# Altium project ADC_System_PCB.PrjPcb (part 2 of 3)

## Sheet double_preamp.SchDoc: 2-Channel programmable gain amplifier
size A4; DocumentNumber: ADC-SCH-07; SheetNumber: 7; SheetTotal: 20
Used 2 times, as channels U_analog_assembly/U_signal_processing_assembly/U_double_preamp, U_analog_assembly/U_signal_processing_assembly/U_double_preamp. Parts and nets are listed once, with the designators drawn on the sheet.
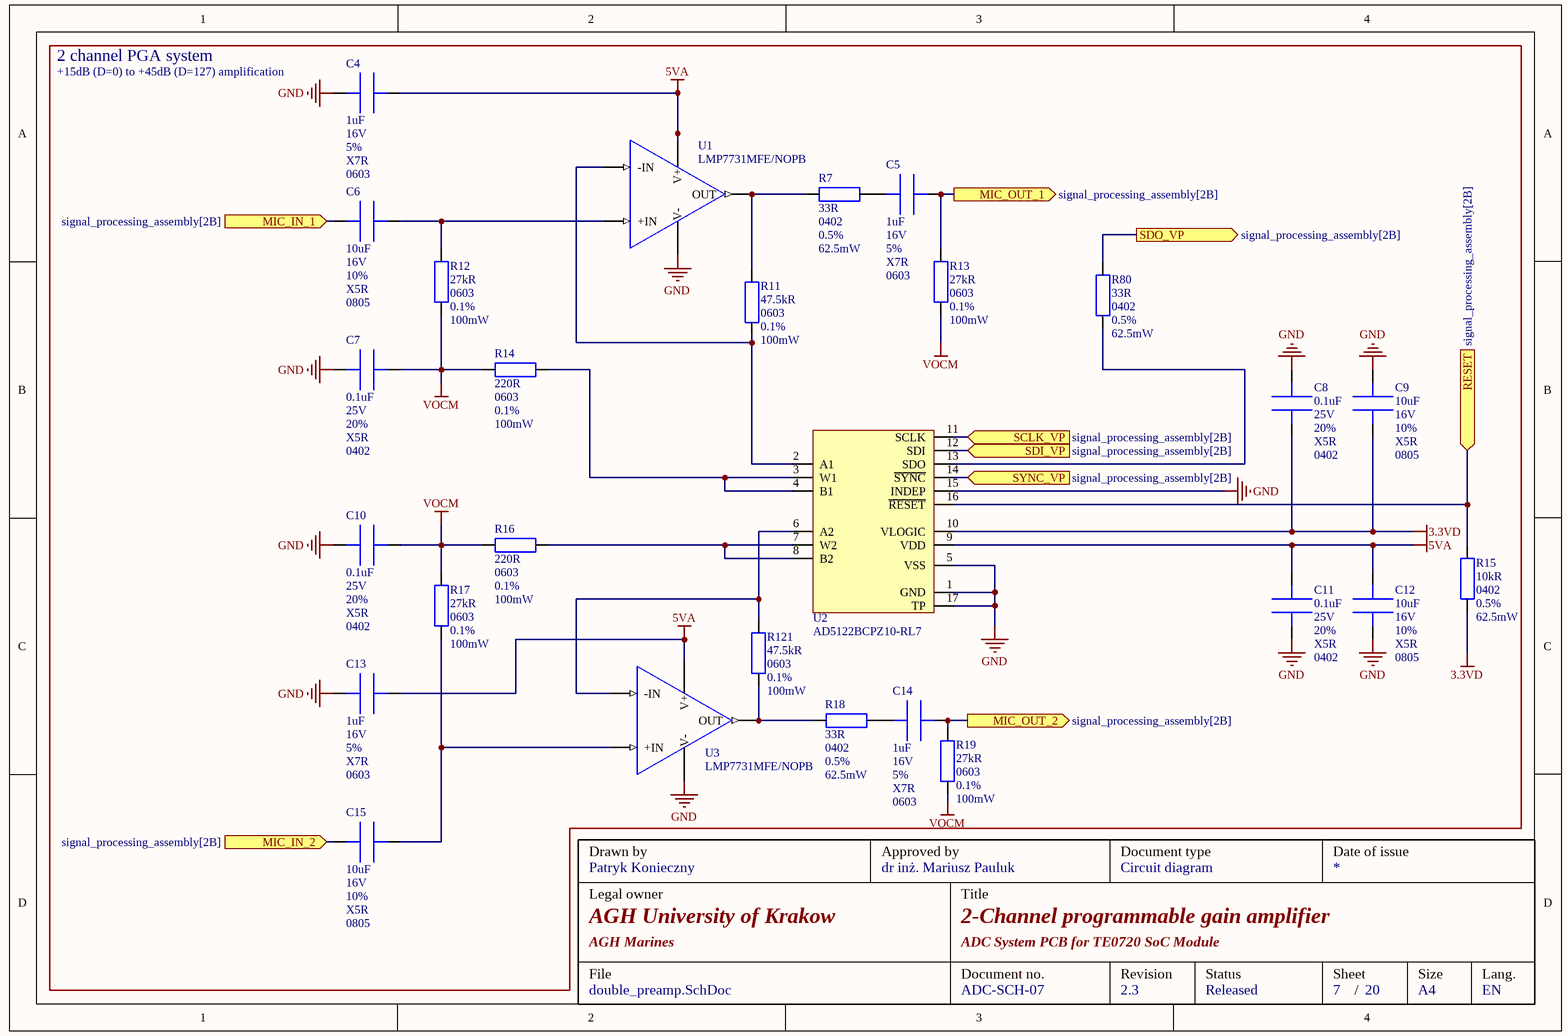
[diagram p10: double_preamp.SchDoc]

### Parts
C4  value 1uF  Voltage: 16V  Tolerance: 5%  Dielectric: X7R  Package: 0603  [CAPC_0603]  (hidden comment: CC0603JRX7R7BB105)
C5  value 1uF  Voltage: 16V  Tolerance: 5%  Dielectric: X7R  Package: 0603  [CAPC_0603]  (hidden comment: CC0603JRX7R7BB105)
C6  value 10uF  Voltage: 16V  Tolerance: 10%  Dielectric: X5R  Package: 0805  [CAPC_0805]  (hidden comment: EMK212BJ106KG-T)
C7  value 0.1uF  Voltage: 25V  Tolerance: 20%  Dielectric: X5R  Package: 0402  [CAPC_0402]  (hidden comment: MSAST105SB5104MFNA01)
C8  value 0.1uF  Voltage: 25V  Tolerance: 20%  Dielectric: X5R  Package: 0402  [CAPC_0402]  (hidden comment: MSAST105SB5104MFNA01)
C9  value 10uF  Voltage: 16V  Tolerance: 10%  Dielectric: X5R  Package: 0805  [CAPC_0805]  (hidden comment: EMK212BJ106KG-T)
C10  value 0.1uF  Voltage: 25V  Tolerance: 20%  Dielectric: X5R  Package: 0402  [CAPC_0402]  (hidden comment: MSAST105SB5104MFNA01)
C11  value 0.1uF  Voltage: 25V  Tolerance: 20%  Dielectric: X5R  Package: 0402  [CAPC_0402]  (hidden comment: MSAST105SB5104MFNA01)
C12  value 10uF  Voltage: 16V  Tolerance: 10%  Dielectric: X5R  Package: 0805  [CAPC_0805]  (hidden comment: EMK212BJ106KG-T)
C13  value 1uF  Voltage: 16V  Tolerance: 5%  Dielectric: X7R  Package: 0603  [CAPC_0603]  (hidden comment: CC0603JRX7R7BB105)
C14  value 1uF  Voltage: 16V  Tolerance: 5%  Dielectric: X7R  Package: 0603  [CAPC_0603]  (hidden comment: CC0603JRX7R7BB105)
C15  value 10uF  Voltage: 16V  Tolerance: 10%  Dielectric: X5R  Package: 0805  [CAPC_0805]  (hidden comment: EMK212BJ106KG-T)
R7  value 33R  Package: 0402  Tolerance: 0.5%  Power: 62.5mW  [RESC_0402]  (hidden comment: RG1005R-330-D-T10)
R11  value 47.5kR  Package: 0603  Tolerance: 0.1%  Power: 100mW  [RESC_0603]  (hidden comment: ERA-3AEB4752V)
R12  value 27kR  Package: 0603  Tolerance: 0.1%  Power: 100mW  [RESC_0603]  (hidden comment: ERA-3AEB273V)
R13  value 27kR  Package: 0603  Tolerance: 0.1%  Power: 100mW  [RESC_0603]  (hidden comment: ERA-3AEB273V)
R14  value 220R  Package: 0603  Tolerance: 0.1%  Power: 100mW  [RESC_0603]  (hidden comment: RT0603BRE07220RL)
R15  value 10kR  Package: 0402  Tolerance: 0.5%  Power: 62.5mW  [RESC_0402]  (hidden comment: AC0402DR-0710KL)
R16  value 220R  Package: 0603  Tolerance: 0.1%  Power: 100mW  [RESC_0603]  (hidden comment: RT0603BRE07220RL)
R17  value 27kR  Package: 0603  Tolerance: 0.1%  Power: 100mW  [RESC_0603]  (hidden comment: ERA-3AEB273V)
R18  value 33R  Package: 0402  Tolerance: 0.5%  Power: 62.5mW  [RESC_0402]  (hidden comment: RG1005R-330-D-T10)
R19  value 27kR  Package: 0603  Tolerance: 0.1%  Power: 100mW  [RESC_0603]  (hidden comment: ERA-3AEB273V)
R80  value 33R  Package: 0402  Tolerance: 0.5%  Power: 62.5mW  [RESC_0402]  (hidden comment: RG1005R-330-D-T10)
R121  value 47.5kR  Package: 0603  Tolerance: 0.1%  Power: 100mW  [RESC_0603]  (hidden comment: ERA-3AEB4752V)
U1  LMP7731MFE/NOPB  [IC_SOT-23-5]
U2  AD5122BCPZ10-RL7  [IC_LFCSP-16]
U3  LMP7731MFE/NOPB  [IC_SOT-23-5]

### Ports
MIC_IN_1 (in, see signal_processing_assembly[2B]), MIC_IN_2 (in, see signal_processing_assembly[2B]), MIC_OUT_1 (out, see signal_processing_assembly[2B]), MIC_OUT_2 (out, see signal_processing_assembly[2B]), RESET (in, see signal_processing_assembly[2B]), SCLK_VP (in, see signal_processing_assembly[2B]), SDI_VP (in, see signal_processing_assembly[2B]), SDO_VP (out, see signal_processing_assembly[2B]), SYNC_VP (in, see signal_processing_assembly[2B])

### Nets
3.3VD: C8.2 C9.2 R15.2 U2.10(VLOGIC)
5VA: C4.1 C11.1 C12.1 C13.1 U1.5(V+) U2.9(VDD) U3.5(V+)
GND: C4.2 C7.2 C8.1 C9.1 C10.2 C11.2 C12.2 C13.2 U1.2(V-) U2.1(GND) U2.5(VSS) U2.15(INDEP) U2.17(TP) U3.2(V-)
VOCM: C7.1 C10.1 R12.2 R13.2 R14.2 R16.2 R17.1 R19.2
MIC_IN_1: C6.2 ; port MIC_IN_1
MIC_IN_2: C15.2 ; port MIC_IN_2
MIC_OUT_1: C5.1 R13.1 ; port MIC_OUT_1
MIC_OUT_2: C14.1 R19.1 ; port MIC_OUT_2
RESET: R15.1 U2.16(~{RESET}) ; port RESET
SCLK_VP: U2.11(SCLK) ; port SCLK_VP
SDI_VP: U2.12(SDI) ; port SDI_VP
SDO_VP: R80.1 ; port SDO_VP
SYNC_VP: U2.14(~{SYNC}) ; port SYNC_VP
NetC5_2: C5.2 R7.1
NetC6_1: C6.1 R12.1 U1.3(+IN)
NetC14_2: C14.2 R18.1
NetC15_1: C15.1 R17.2 U3.3(+IN)
NetR7_2: R7.2 R11.1 U1.1(OUT)
NetR11_2: R11.2 U1.4(-IN) U2.2(A1)
NetR14_1: R14.1 U2.3(W1) U2.4(B1)
NetR16_1: R16.1 U2.7(W2) U2.8(B2)
NetR18_2: R18.2 R121.2 U3.1(OUT)
NetR80_2: R80.2 U2.13(SDO)
NetR121_1: R121.1 U2.6(A2) U3.4(-IN)

### Channels
U_analog_assembly/U_signal_processing_assembly/U_double_preamp: designators end in _U_double_preamp2; ports MIC_IN_1=NetC6_U_double_preamp2_2 MIC_IN_2=NetC15_U_double_preamp2_2 MIC_OUT_1=NetC5_U_double_preamp2_1 MIC_OUT_2=NetC14_U_double_preamp2_1 RESET=NetJM1_47 SCLK_VP=SCLK_VP SDI_VP=NetR80_U_double_preamp1_1 SDO_VP=SDI_VP SYNC_VP=SYNC_VP
U_analog_assembly/U_signal_processing_assembly/U_double_preamp: designators end in _U_double_preamp1; ports MIC_IN_1=NetC6_U_double_preamp1_2 MIC_IN_2=NetC15_U_double_preamp1_2 MIC_OUT_1=NetC5_U_double_preamp1_1 MIC_OUT_2=NetC14_U_double_preamp1_1 RESET=NetJM1_45 SCLK_VP=SCLK_VP SDI_VP=SDO_VP SDO_VP=NetR80_U_double_preamp1_1 SYNC_VP=SYNC_VP

### Notes on the sheet
- 2 channel PGA system
- (near C4) +15dB (D=0) to +45dB (D=127) amplification
- Drawn by
- Approved by
- Document type
- Date of issue
- Legal owner
- Title
- Circuit diagram
- File
- AGH Marines
- Document no.
- Revision
- Status
- Sheet
- Size
- Lang.
- /
- A4
- EN

### Library data of the parts
C4 C5 C13 C14 = CC0603JRX7R7BB105: as C1 on sheet MIC_connection; Supplier 1: Mouser; Supplier Part Number 1: 603-CC0603JRX77BB105
C6 C9 C12 C15 = EMK212BJ106KG-T: Multilayer Ceramic Capacitors MLCC - SMD/SMT 16V 10uF X5R 0805 10 %; Manufacturer: TAIYO YUDEN; Supplier 1: Mouser; Supplier Part Number 1: 963-EMK212BJ106KG-T
C7 C8 C10 C11 = MSAST105SB5104MFNA01: as C61 on sheet JTAG; Supplier 1: Mouser; Supplier Part Number 1: 963-MSAST105SB5104MF
R7 R18 R80 = RG1005R-330-D-T10: as R110 on sheet JTAG; Supplier 1: Mouser; Supplier Part Number 1: 754-RG1005R-330DT10
R11 R121 = ERA-3AEB4752V: Thin Film Resistors 0603 47.5Kohm 0.1% 25ppm; Manufacturer: Panasonic; Supplier 1: Mouser; Supplier Part Number 1: 667-ERA-3AEB4752V
R12 R13 R17 R19 = ERA-3AEB273V: Thin Film Resistors 0603 1/10W 27Kohms; Manufacturer: Panasonic; Supplier 1: Mouser; Supplier Part Number 1: 667-ERA-3AEB273V
R14 R16 = RT0603BRE07220RL: Thin Film Resistors; Manufacturer: YAGEO; Supplier 1: Mouser; Supplier Part Number 1: 603-RT0603BRE07220RL
R15 = AC0402DR-0710KL: as R96 on sheet power_management; Supplier 1: Mouser; Supplier Part Number 1: 603-AC0402DR-0710KL
U1 U3 = LMP7731MFE/NOPB: Precision Amplifiers Single 2.9 nV/sqrt(H z) Low Noise Precis A 926-LMP7731MF/NOPB; Manufacturer: Texas Instruments; Package: SOT-23-5; Supplier 1: Mouser; Supplier Part Number 1: 926-LMP7731MFE/NOPB
U2 = AD5122BCPZ10-RL7: Digital Potentiometer ICs 128tap, Dual DigiPOT, NVM, SPI; Manufacturer: Analog Devices; Package: LFCSP-16; Supplier 1: Mouser; Supplier Part Number 1: 584-AD5122BCPZ10-R7

## Sheet double_single_to_diff_conv.SchDoc: Single ended to differential analog signal conversion
size A4; DocumentNumber: ADC-SCH-08; SheetNumber: 8; SheetTotal: 20
Used 2 times, as channels U_analog_assembly/U_signal_processing_assembly/U_double_single_to_diff_conv, U_analog_assembly/U_signal_processing_assembly/U_double_single_to_diff_conv. Parts and nets are listed once, with the designators drawn on the sheet.
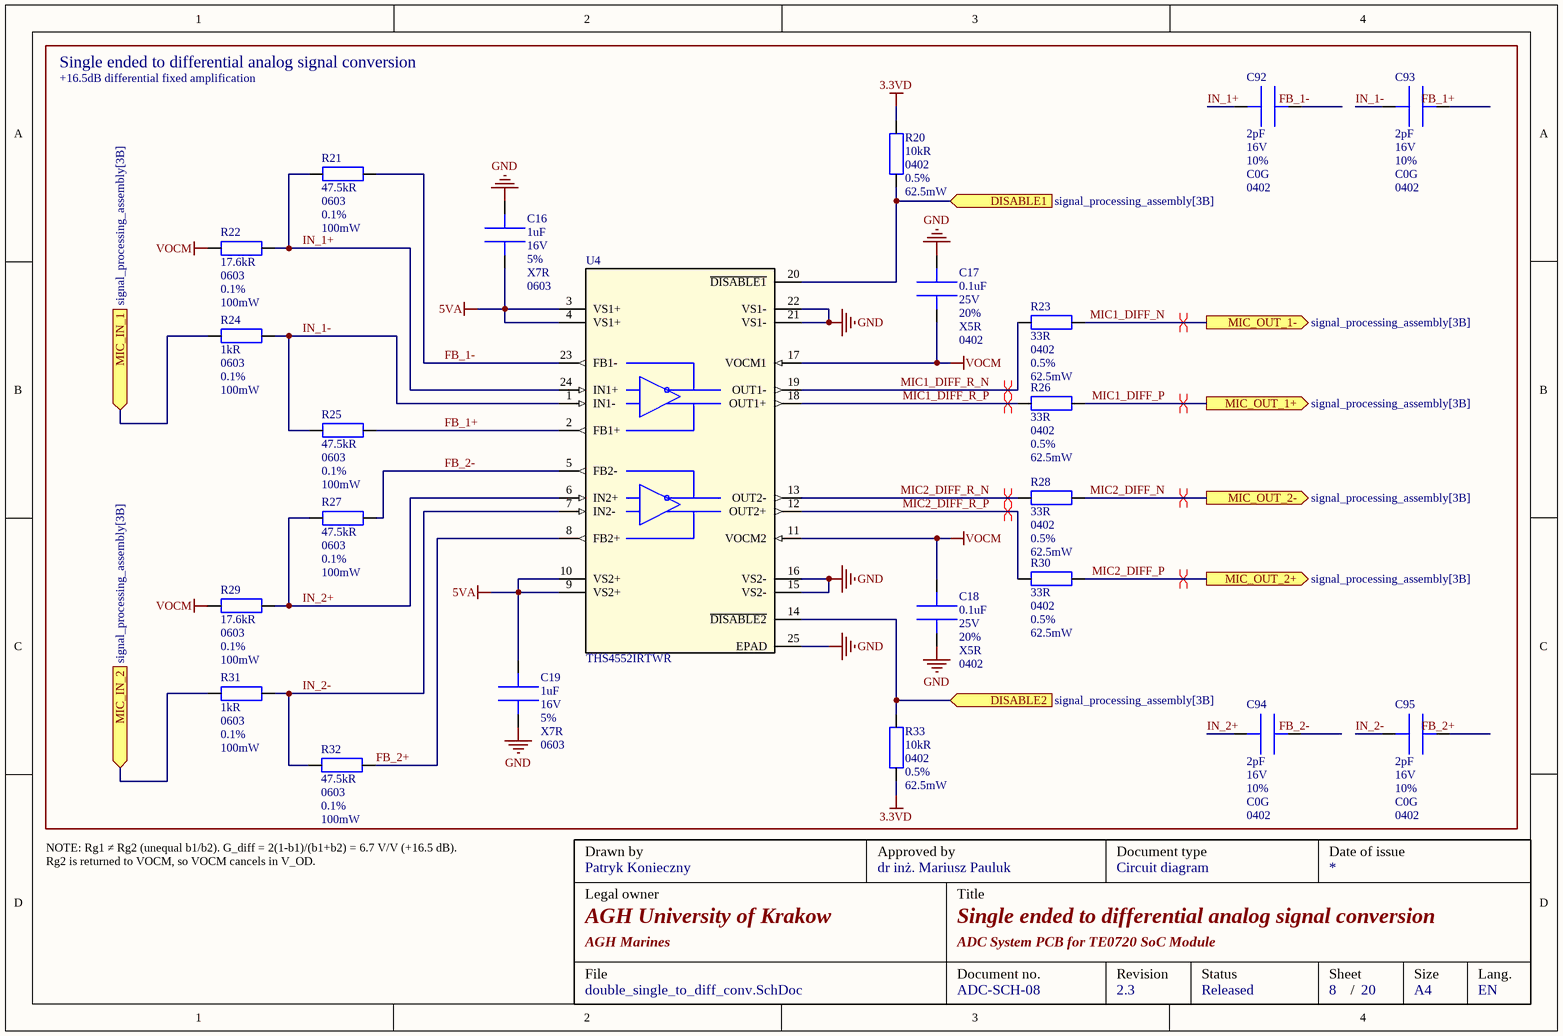
[diagram p11: double_single_to_diff_conv.SchDoc]

### Parts
C16  value 1uF  Voltage: 16V  Tolerance: 5%  Dielectric: X7R  Package: 0603  [CAPC_0603]  (hidden comment: CC0603JRX7R7BB105)
C17  value 0.1uF  Voltage: 25V  Tolerance: 20%  Dielectric: X5R  Package: 0402  [CAPC_0402]  (hidden comment: MSAST105SB5104MFNA01)
C18  value 0.1uF  Voltage: 25V  Tolerance: 20%  Dielectric: X5R  Package: 0402  [CAPC_0402]  (hidden comment: MSAST105SB5104MFNA01)
C19  value 1uF  Voltage: 16V  Tolerance: 5%  Dielectric: X7R  Package: 0603  [CAPC_0603]  (hidden comment: CC0603JRX7R7BB105)
C92  value 2pF  Voltage: 16V  Tolerance: 10%  Dielectric: C0G  Package: 0402  [CAPC_0402]  (hidden comment: GJM1555C1H2R0CB01J)
C93  value 2pF  Voltage: 16V  Tolerance: 10%  Dielectric: C0G  Package: 0402  [CAPC_0402]  (hidden comment: GJM1555C1H2R0CB01J)
C94  value 2pF  Voltage: 16V  Tolerance: 10%  Dielectric: C0G  Package: 0402  [CAPC_0402]  (hidden comment: GJM1555C1H2R0CB01J)
C95  value 2pF  Voltage: 16V  Tolerance: 10%  Dielectric: C0G  Package: 0402  [CAPC_0402]  (hidden comment: GJM1555C1H2R0CB01J)
R20  value 10kR  Package: 0402  Tolerance: 0.5%  Power: 62.5mW  [RESC_0402]  (hidden comment: AC0402DR-0710KL)
R21  value 47.5kR  Package: 0603  Tolerance: 0.1%  Power: 100mW  [RESC_0603]  (hidden comment: ERA-3AEB4752V)
R22  value 17.6kR  Package: 0603  Tolerance: 0.1%  Power: 100mW  [RESC_0603]  (hidden comment: TNPW060317K6BEEA)
R23  value 33R  Package: 0402  Tolerance: 0.5%  Power: 62.5mW  [RESC_0402]  (hidden comment: RG1005R-330-D-T10)
R24  value 1kR  Package: 0603  Tolerance: 0.1%  Power: 100mW  [RESC_0603]  (hidden comment: RP0603BRD071KL)
R25  value 47.5kR  Package: 0603  Tolerance: 0.1%  Power: 100mW  [RESC_0603]  (hidden comment: ERA-3AEB4752V)
R26  value 33R  Package: 0402  Tolerance: 0.5%  Power: 62.5mW  [RESC_0402]  (hidden comment: RG1005R-330-D-T10)
R27  value 47.5kR  Package: 0603  Tolerance: 0.1%  Power: 100mW  [RESC_0603]  (hidden comment: ERA-3AEB4752V)
R28  value 33R  Package: 0402  Tolerance: 0.5%  Power: 62.5mW  [RESC_0402]  (hidden comment: RG1005R-330-D-T10)
R29  value 17.6kR  Package: 0603  Tolerance: 0.1%  Power: 100mW  [RESC_0603]  (hidden comment: TNPW060317K6BEEA)
R30  value 33R  Package: 0402  Tolerance: 0.5%  Power: 62.5mW  [RESC_0402]  (hidden comment: RG1005R-330-D-T10)
R31  value 1kR  Package: 0603  Tolerance: 0.1%  Power: 100mW  [RESC_0603]  (hidden comment: RP0603BRD071KL)
R32  value 47.5kR  Package: 0603  Tolerance: 0.1%  Power: 100mW  [RESC_0603]  (hidden comment: ERA-3AEB4752V)
R33  value 10kR  Package: 0402  Tolerance: 0.5%  Power: 62.5mW  [RESC_0402]  (hidden comment: AC0402DR-0710KL)
U4  THS4552IRTWR  [IC_QFN-24_UF_LIT]

### Ports
DISABLE1 (in, see signal_processing_assembly[3B]), DISABLE2 (in, see signal_processing_assembly[3B]), MIC_IN_1 (in, see signal_processing_assembly[3B]), MIC_IN_2 (in, see signal_processing_assembly[3B]), MIC_OUT_1+ (out, see signal_processing_assembly[3B]), MIC_OUT_1- (out, see signal_processing_assembly[3B]), MIC_OUT_2+ (out, see signal_processing_assembly[3B]), MIC_OUT_2- (out, see signal_processing_assembly[3B])

### Nets
3.3VD: R20.1 R33.2
5VA: C16.2 C19.1 U4.3(VS1+) U4.4(VS1+) U4.9(VS2+) U4.10(VS2+)
GND: C16.1 C17.1 C18.2 C19.2 U4.15(VS2-) U4.16(VS2-) U4.21(VS1-) U4.22(VS1-) U4.25(EPAD)
VOCM: C17.2 C18.1 R22.2 R29.2 U4.11(VOCM2) U4.17(VOCM1)
DISABLE1: R20.2 U4.20(~{DISABLE1}) ; port DISABLE1
DISABLE2: R33.1 U4.14(~{DISABLE2}) ; port DISABLE2
FB_1+: C93.1 R25.1 U4.2(FB1+)
FB_1-: C92.1 R21.1 U4.23(FB1-)
FB_2+: C95.1 R32.1 U4.8(FB2+)
FB_2-: C94.1 R27.1 U4.5(FB2-)
IN_1+: C92.2 R21.2 R22.1 U4.24(IN1+)
IN_1-: C93.2 R24.1 R25.2 U4.1(IN1-)
IN_2+: C94.2 R27.2 R29.1 U4.6(IN2+)
IN_2-: C95.2 R31.1 R32.2 U4.7(IN2-)
MIC1_DIFF_N: R23.1 ; port MIC_OUT_1-
MIC1_DIFF_P: R26.1 ; port MIC_OUT_1+
MIC1_DIFF_R_N: R23.2 U4.19(OUT1-)
MIC1_DIFF_R_P: R26.2 U4.18(OUT1+)
MIC2_DIFF_N: R28.1 ; port MIC_OUT_2-
MIC2_DIFF_P: R30.1 ; port MIC_OUT_2+
MIC2_DIFF_R_N: R28.2 U4.13(OUT2-)
MIC2_DIFF_R_P: R30.2 U4.12(OUT2+)
MIC_IN_1: R24.2 ; port MIC_IN_1
MIC_IN_2: R31.2 ; port MIC_IN_2

### Channels
U_analog_assembly/U_signal_processing_assembly/U_double_single_to_diff_conv: designators end in _U_double_single_to_diff_conv2; ports DISABLE1=NetJM1_77 DISABLE2=NetJM1_75 MIC_IN_1=NetC5_U_double_preamp2_1 MIC_IN_2=NetC14_U_double_preamp2_1 MIC_OUT_1+=MIC1_DIFF_P MIC_OUT_1-=MIC1_DIFF_N MIC_OUT_2+=MIC2_DIFF_P MIC_OUT_2-=MIC2_DIFF_N
U_analog_assembly/U_signal_processing_assembly/U_double_single_to_diff_conv: designators end in _U_double_single_to_diff_conv1; ports DISABLE1=NetJM1_81 DISABLE2=NetJM1_79 MIC_IN_1=NetC5_U_double_preamp1_1 MIC_IN_2=NetC14_U_double_preamp1_1 MIC_OUT_1+=MIC1_DIFF_P MIC_OUT_1-=MIC1_DIFF_N MIC_OUT_2+=MIC2_DIFF_P MIC_OUT_2-=MIC2_DIFF_N

### Layout directives
differential pair: MIC1_DIFF_N, MIC1_DIFF_P, MIC1_DIFF_R_N_U_double_single_to_diff_conv, MIC1_DIFF_R_P_U_double_single_to_diff_conv, MIC2_DIFF_N, MIC2_DIFF_P, MIC2_DIFF_R_N_U_double_single_to_diff_conv, MIC2_DIFF_R_P_U_double_single_to_diff_conv

### Notes on the sheet
- Single ended to differential analog signal conversion
- +16.5dB differential fixed amplification
- NOTE: Rg1 ≠ Rg2 (unequal b1/b2). G_diff = 2(1-b1)/(b1+b2) = 6.7 V/V (+16.5 dB).
  Rg2 is returned to VOCM, so VOCM cancels in V_OD.
- Drawn by
- Approved by
- Document type
- Date of issue
- Legal owner
- Title
- Circuit diagram
- File
- AGH Marines
- Document no.
- Revision
- Status
- Sheet
- Size
- Lang.
- /
- A4
- EN

### Library data of the parts
C16 C19 = CC0603JRX7R7BB105: Multilayer Ceramic Capacitors MLCC - SMD/SMT 16V 1uF X7R 0603 5% HI CV; Manufacturer: YAGEO; Supplier 1: Mouser; Supplier Part Number 1: 603-CC0603JRX77BB105
C17 C18 = MSAST105SB5104MFNA01: Multilayer Ceramic Capacitors MLCC - SMD/SMT 25V 0.1uF X5R 0402 20%; Manufacturer: TAIYO YUDEN; Supplier 1: Mouser; Supplier Part Number 1: 963-MSAST105SB5104MF
C92-C95 = GJM1555C1H2R0CB01J: Multilayer Ceramic Capacitors MLCC - SMD/SMT 2 pF 50 VDC 0.25 pF 0402 C0G (NP0); Manufacturer: Murata Electronics; Supplier 1: Mouser; Supplier Part Number 1: 81-GJM1555C1H2R0CB1J
R20 R33 = AC0402DR-0710KL: Thick Film Resistors - SMD 10 kOhms 1/16 W 50 V 1% 0402 100 PPM / C - 55 C + 155 C AEC-Q200; Manufacturer: YAGEO; Supplier 1: Mouser; Supplier Part Number 1: 603-AC0402DR-0710KL
R21 R25 R27 R32 = ERA-3AEB4752V: Thin Film Resistors 0603 47.5Kohm 0.1% 25ppm; Manufacturer: Panasonic; Supplier 1: Mouser; Supplier Part Number 1: 667-ERA-3AEB4752V
R22 R29 = TNPW060317K6BEEA: Thin Film Resistors 17.6Kohms .1% 25ppm; Manufacturer: Vishay; Supplier 1: Mouser; Supplier Part Number 1: 71-TNPW060317K6BEEA
R23 R26 R28 R30 = RG1005R-330-D-T10: Thin Film Resistors - SMD 1/16W 33 Ohms 0.5% 0402 100ppm; Manufacturer: Susumu; Supplier 1: Mouser; Supplier Part Number 1: 754-RG1005R-330DT10
R24 R31 = RP0603BRD071KL: Thin Film Resistors 1/10 Wat 1K Ohm 0.1% 0603 AEC-Q200; Manufacturer: YAGEO; Supplier 1: Mouser; Supplier Part Number 1: 603-RP0603BRD071KL
U4 = THS4552IRTWR: Differential Amplifiers Dual Channel Low-No ise Precision 150- A 595-THS4552IRTWT; Manufacturer: Texas Instruments; Package: LFCSP-24; Supplier 1: Mouser; Supplier Part Number 1: 595-THS4552IRTWR

## Sheet band_pass_diff_filter.SchDoc: Band-pass differential filter
size A4; DocumentNumber: ADC-SCH-06; SheetNumber: 6; SheetTotal: 20
Used 4 times, as channels U_analog_assembly/U_signal_processing_assembly/U_band_pass_diff_filter, U_analog_assembly/U_signal_processing_assembly/U_band_pass_diff_filter, U_analog_assembly/U_signal_processing_assembly/U_band_pass_diff_filter, U_analog_assembly/U_signal_processing_assembly/U_band_pass_diff_filter. Parts and nets are listed once, with the designators drawn on the sheet.
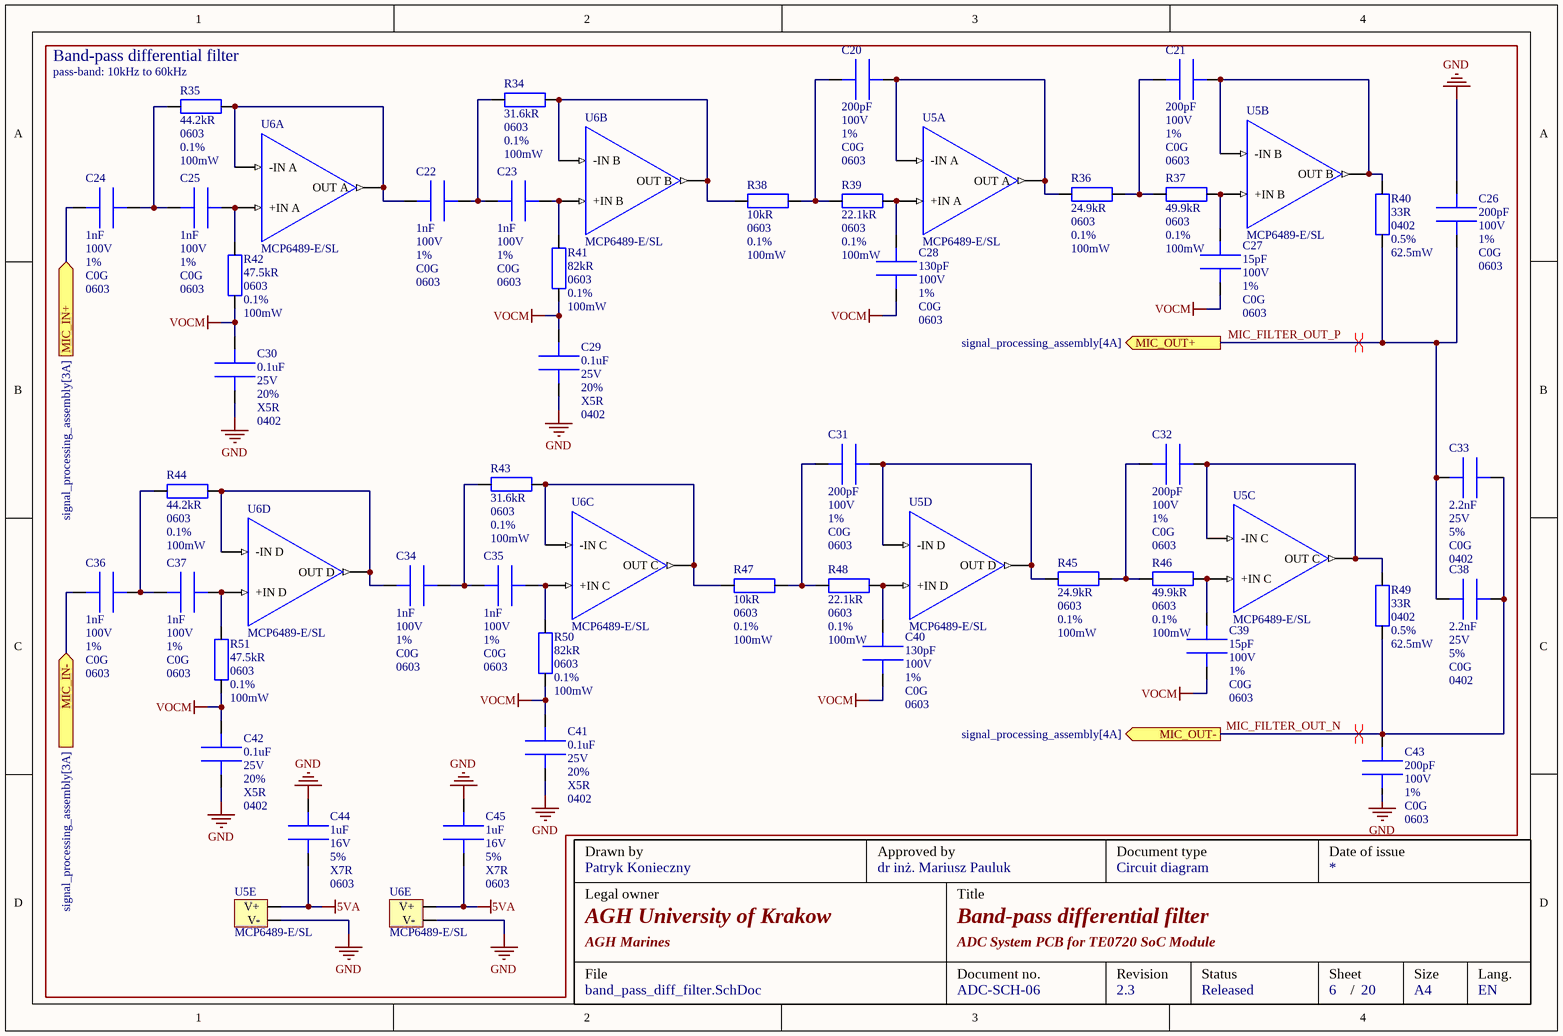
[diagram p12: band_pass_diff_filter.SchDoc]

### Parts
C20  value 200pF  Voltage: 100V  Tolerance: 1%  Dielectric: C0G  Package: 0603  [CAPC_0603]  (hidden comment: C0402C221J3GACTU)
C21  value 200pF  Voltage: 100V  Tolerance: 1%  Dielectric: C0G  Package: 0603  [CAPC_0603]  (hidden comment: C0402C221J3GACTU)
C22  value 1nF  Voltage: 100V  Tolerance: 1%  Dielectric: C0G  Package: 0603  [CAPC_0603]  (hidden comment: C0603C153G4GACTU)
C23  value 1nF  Voltage: 100V  Tolerance: 1%  Dielectric: C0G  Package: 0603  [CAPC_0603]  (hidden comment: C0603C153G4GACTU)
C24  value 1nF  Voltage: 100V  Tolerance: 1%  Dielectric: C0G  Package: 0603  [CAPC_0603]  (hidden comment: C0603C153G4GACTU)
C25  value 1nF  Voltage: 100V  Tolerance: 1%  Dielectric: C0G  Package: 0603  [CAPC_0603]  (hidden comment: C0603C153G4GACTU)
C26  value 200pF  Voltage: 100V  Tolerance: 1%  Dielectric: C0G  Package: 0603  [CAPC_0603]  (hidden comment: C0402C221J3GACTU)
C27  value 15pF  Voltage: 100V  Tolerance: 1%  Dielectric: C0G  Package: 0603  [CAPC_0603]  (hidden comment: KGM15ACG1H150FT)
C28  value 130pF  Voltage: 100V  Tolerance: 1%  Dielectric: C0G  Package: 0603  [CAPC_0603]  (hidden comment: C0603C131F5GACTU)
C29  value 0.1uF  Voltage: 25V  Tolerance: 20%  Dielectric: X5R  Package: 0402  [CAPC_0402]  (hidden comment: MSAST105SB5104MFNA01)
C30  value 0.1uF  Voltage: 25V  Tolerance: 20%  Dielectric: X5R  Package: 0402  [CAPC_0402]  (hidden comment: MSAST105SB5104MFNA01)
C31  value 200pF  Voltage: 100V  Tolerance: 1%  Dielectric: C0G  Package: 0603  [CAPC_0603]  (hidden comment: C0402C221J3GACTU)
C32  value 200pF  Voltage: 100V  Tolerance: 1%  Dielectric: C0G  Package: 0603  [CAPC_0603]  (hidden comment: C0402C221J3GACTU)
C33  value 2.2nF  Voltage: 25V  Tolerance: 5%  Dielectric: C0G  Package: 0402  [CAPC_0402]  (hidden comment: C0402C222J3GACTU)
C34  value 1nF  Voltage: 100V  Tolerance: 1%  Dielectric: C0G  Package: 0603  [CAPC_0603]  (hidden comment: C0603C153G4GACTU)
C35  value 1nF  Voltage: 100V  Tolerance: 1%  Dielectric: C0G  Package: 0603  [CAPC_0603]  (hidden comment: C0603C153G4GACTU)
C36  value 1nF  Voltage: 100V  Tolerance: 1%  Dielectric: C0G  Package: 0603  [CAPC_0603]  (hidden comment: C0603C153G4GACTU)
C37  value 1nF  Voltage: 100V  Tolerance: 1%  Dielectric: C0G  Package: 0603  [CAPC_0603]  (hidden comment: C0603C153G4GACTU)
C38  value 2.2nF  Voltage: 25V  Tolerance: 5%  Dielectric: C0G  Package: 0402  [CAPC_0402]  (hidden comment: C0402C222J3GACTU)
C39  value 15pF  Voltage: 100V  Tolerance: 1%  Dielectric: C0G  Package: 0603  [CAPC_0603]  (hidden comment: KGM15ACG1H150FT)
C40  value 130pF  Voltage: 100V  Tolerance: 1%  Dielectric: C0G  Package: 0603  [CAPC_0603]  (hidden comment: C0603C131F5GACTU)
C41  value 0.1uF  Voltage: 25V  Tolerance: 20%  Dielectric: X5R  Package: 0402  [CAPC_0402]  (hidden comment: MSAST105SB5104MFNA01)
C42  value 0.1uF  Voltage: 25V  Tolerance: 20%  Dielectric: X5R  Package: 0402  [CAPC_0402]  (hidden comment: MSAST105SB5104MFNA01)
C43  value 200pF  Voltage: 100V  Tolerance: 1%  Dielectric: C0G  Package: 0603  [CAPC_0603]  (hidden comment: C0402C221J3GACTU)
C44  value 1uF  Voltage: 16V  Tolerance: 5%  Dielectric: X7R  Package: 0603  [CAPC_0603]  (hidden comment: CC0603JRX7R7BB105)
C45  value 1uF  Voltage: 16V  Tolerance: 5%  Dielectric: X7R  Package: 0603  [CAPC_0603]  (hidden comment: CC0603JRX7R7BB105)
R34  value 31.6kR  Package: 0603  Tolerance: 0.1%  Power: 100mW  [RESC_0603]  (hidden comment: RT0603BRD0731K6L)
R35  value 44.2kR  Package: 0603  Tolerance: 0.1%  Power: 100mW  [RESC_0603]  (hidden comment: RP0603BRD073K65L)
R36  value 24.9kR  Package: 0603  Tolerance: 0.1%  Power: 100mW  [RESC_0603]  (hidden comment: ERA-3AEB2492V)
R37  value 49.9kR  Package: 0603  Tolerance: 0.1%  Power: 100mW  [RESC_0603]  (hidden comment: RG1608P-4992-B-T5)
R38  value 10kR  Package: 0603  Tolerance: 0.1%  Power: 100mW  [RESC_0603]  (hidden comment: RT0603BRD0710KL)
R39  value 22.1kR  Package: 0603  Tolerance: 0.1%  Power: 100mW  [RESC_0603]  (hidden comment: RT0603BRD0722K1L)
R40  value 33R  Package: 0402  Tolerance: 0.5%  Power: 62.5mW  [RESC_0402]  (hidden comment: RG1005R-330-D-T10)
R41  value 82kR  Package: 0603  Tolerance: 0.1%  Power: 100mW  [RESC_0603]  (hidden comment: RT0603BRD0782KL)
R42  value 47.5kR  Package: 0603  Tolerance: 0.1%  Power: 100mW  [RESC_0603]  (hidden comment: ERA-3AEB4752V)
R43  value 31.6kR  Package: 0603  Tolerance: 0.1%  Power: 100mW  [RESC_0603]  (hidden comment: RT0603BRD0731K6L)
R44  value 44.2kR  Package: 0603  Tolerance: 0.1%  Power: 100mW  [RESC_0603]  (hidden comment: RP0603BRD073K65L)
R45  value 24.9kR  Package: 0603  Tolerance: 0.1%  Power: 100mW  [RESC_0603]  (hidden comment: ERA-3AEB2492V)
R46  value 49.9kR  Package: 0603  Tolerance: 0.1%  Power: 100mW  [RESC_0603]  (hidden comment: RG1608P-4992-B-T5)
R47  value 10kR  Package: 0603  Tolerance: 0.1%  Power: 100mW  [RESC_0603]  (hidden comment: RT0603BRD0710KL)
R48  value 22.1kR  Package: 0603  Tolerance: 0.1%  Power: 100mW  [RESC_0603]  (hidden comment: RT0603BRD0722K1L)
R49  value 33R  Package: 0402  Tolerance: 0.5%  Power: 62.5mW  [RESC_0402]  (hidden comment: RG1005R-330-D-T10)
R50  value 82kR  Package: 0603  Tolerance: 0.1%  Power: 100mW  [RESC_0603]  (hidden comment: RT0603BRD0782KL)
R51  value 47.5kR  Package: 0603  Tolerance: 0.1%  Power: 100mW  [RESC_0603]  (hidden comment: ERA-3AEB4752V)
U5  MCP6489-E/SL  [IC_SOIC14]  (parts A,B,C,D,E of 5)
U6  MCP6489-E/SL  [IC_SOIC14]  (parts A,B,C,D,E of 5)

### Ports
MIC_IN+ (in, see signal_processing_assembly[3A]), MIC_IN- (in, see signal_processing_assembly[3A]), MIC_OUT+ (out, see signal_processing_assembly[4A]), MIC_OUT- (out, see signal_processing_assembly[4A])

### Nets
5VA: C44.2 C45.2 U5.4(V+) U6.4(V+)
GND: C26.1 C29.2 C30.2 C41.2 C42.2 C43.2 C44.1 C45.1 U5.11(V-) U6.11(V-)
VOCM: C27.2 C28.2 C29.1 C30.1 C39.2 C40.2 C41.1 C42.1 R41.2 R42.2 R50.2 R51.2
MIC_FILTER_OUT_N: C33.1 C38.1 C43.1 R49.2 ; port MIC_OUT-
MIC_FILTER_OUT_P: C26.2 C33.2 C38.2 R40.2 ; port MIC_OUT+
MIC_IN+: C24.2 ; port MIC_IN+
MIC_IN-: C36.2 ; port MIC_IN-
NetC20_1: C20.1 R38.1 R39.2
NetC20_2: C20.2 R36.2 U5.1(OUT_A) U5.2(-IN_A)
NetC21_1: C21.1 R36.1 R37.2
NetC21_2: C21.2 R40.1 U5.6(-IN_B) U5.7(OUT_B)
NetC22_1: C22.1 C23.2 R34.2
NetC22_2: C22.2 R35.1 U6.1(OUT_A) U6.2(-IN_A)
NetC23_1: C23.1 R41.1 U6.5(+IN_B)
NetC24_1: C24.1 C25.2 R35.2
NetC25_1: C25.1 R42.1 U6.3(+IN_A)
NetC27_1: C27.1 R37.1 U5.5(+IN_B)
NetC28_1: C28.1 R39.1 U5.3(+IN_A)
NetC31_1: C31.1 R47.1 R48.2
NetC31_2: C31.2 R45.2 U5.13(-IN_D) U5.14(OUT_D)
NetC32_1: C32.1 R45.1 R46.2
NetC32_2: C32.2 R49.1 U5.8(OUT_C) U5.9(-IN_C)
NetC34_1: C34.1 C35.2 R43.2
NetC34_2: C34.2 R44.1 U6.13(-IN_D) U6.14(OUT_D)
NetC35_1: C35.1 R50.1 U6.10(+IN_C)
NetC36_1: C36.1 C37.2 R44.2
NetC37_1: C37.1 R51.1 U6.12(+IN_D)
NetC39_1: C39.1 R46.1 U5.10(+IN_C)
NetC40_1: C40.1 R48.1 U5.12(+IN_D)
NetR34_1: R34.1 R38.2 U6.6(-IN_B) U6.7(OUT_B)
NetR43_1: R43.1 R47.2 U6.8(OUT_C) U6.9(-IN_C)

### Channels
U_analog_assembly/U_signal_processing_assembly/U_band_pass_diff_filter: designators end in _U_band_pass_diff_filter4; ports MIC_IN+=MIC1_DIFF_P MIC_IN-=MIC1_DIFF_N MIC_OUT+=MIC_FILTER_OUT_P MIC_OUT-=MIC_FILTER_OUT_N
U_analog_assembly/U_signal_processing_assembly/U_band_pass_diff_filter: designators end in _U_band_pass_diff_filter3; ports MIC_IN+=MIC2_DIFF_P MIC_IN-=MIC2_DIFF_N MIC_OUT+=MIC_FILTER_OUT_P MIC_OUT-=MIC_FILTER_OUT_N
U_analog_assembly/U_signal_processing_assembly/U_band_pass_diff_filter: designators end in _U_band_pass_diff_filter2; ports MIC_IN+=MIC1_DIFF_P MIC_IN-=MIC1_DIFF_N MIC_OUT+=MIC_FILTER_OUT_P MIC_OUT-=MIC_FILTER_OUT_N
U_analog_assembly/U_signal_processing_assembly/U_band_pass_diff_filter: designators end in _U_band_pass_diff_filter1; ports MIC_IN+=MIC2_DIFF_P MIC_IN-=MIC2_DIFF_N MIC_OUT+=MIC_FILTER_OUT_P MIC_OUT-=MIC_FILTER_OUT_N

### Layout directives
differential pair: MIC_FILTER_OUT_N, MIC_FILTER_OUT_P

### Notes on the sheet
- (near R35) Band-pass differential filter
- (near R35) pass-band: 10kHz to 60kHz
- Drawn by
- Approved by
- Document type
- Date of issue
- Legal owner
- Title
- Circuit diagram
- File
- AGH Marines
- Document no.
- Revision
- Status
- Sheet
- Size
- Lang.
- /
- A4
- EN

### Library data of the parts
C20 C21 C26 C31 C32 C43 = GCM1885C2A201FA16J: Multilayer Ceramic Capacitors MLCC - SMD/SMT 200 pF 100 VDC 1% 0603 C0G (NP0) AEC-Q200; Manufacturer: Murata Electronics; Supplier 1: Mouser; Supplier Part Number 1: 81-GCM1885C2A201FA6J
C22-C25 C34-C37 = GCM1885C2A102FA16D: Multilayer Ceramic Capacitors MLCC - SMD/SMT 1000 pF 100 VDC 1% 0603 C0G (NP0) AEC-Q200; Manufacturer: Murata Electronics; Supplier 1: Mouser; Supplier Part Number 1: 81-GCM1885C2A102FA6D
C27 C39 = CC0603FRNPO0BN150: Multilayer Ceramic Capacitors MLCC - SMD/SMT 100V 15pF C0G 0603 1%; Manufacturer: YAGEO; Supplier 1: Mouser; Supplier Part Number 1: 603-CC603FRNPO0BN150
C28 C40 = GCM1885C2A131FA16J: Multilayer Ceramic Capacitors MLCC - SMD/SMT 130 pF 100 VDC 1% 0603 C0G (NP0) AEC-Q200; Manufacturer: Murata Electronics; Supplier 1: Mouser; Supplier Part Number 1: 81-GCM1885C2A131FA6J
C29 C30 C41 C42 = MSAST105SB5104MFNA01: as C17 on sheet double_single_to_diff_conv; Supplier 1: Mouser; Supplier Part Number 1: 963-MSAST105SB5104MF
C33 C38 = C0402C222J3GACTU: Multilayer Ceramic Capacitors MLCC - SMD/SMT 25V 2200pF C0G 0402 5%; Manufacturer: KEMET; Supplier 1: Mouser; Supplier Part Number 1: 80-C0402C222J3GACTU
C44 C45 = CC0603JRX7R7BB105: as C16 on sheet double_single_to_diff_conv; Supplier 1: Mouser; Supplier Part Number 1: 603-CC0603JRX77BB105
R34 R43 = RT0603BRD0731K6L: Thin Film Resistors 1/10W 31.6K ohm .1% 25ppm; Manufacturer: YAGEO; Supplier 1: Mouser; Supplier Part Number 1: 603-RT0603BRD0731K6L
R35 R44 = RT0603BRD0744K2L: Thin Film Resistors 1/10W 44.2K ohm .1% 25ppm; Manufacturer: YAGEO; Supplier 1: Mouser; Supplier Part Number 1: 603-RT0603BRD0744K2L
R36 R45 = ERA-3AEB2492V: Thin Film Resistors 0603 24.9Kohm 0.1% 25ppm; Manufacturer: Panasonic; Supplier 1: Mouser; Supplier Part Number 1: 667-ERA-3AEB2492V
R37 R46 = RG1608P-4992-B-T5: Thin Film Resistors 1/10W 49.9K Ohm 0.1% 0603 25ppm; Manufacturer: Susumu; Supplier 1: Mouser; Supplier Part Number 1: 754-RG1608P-4992-BT5
R38 R47 = RT0603BRD0710KL: Thin Film Resistors 10K ohm 0.1% 1/10W; Manufacturer: YAGEO; Supplier 1: Mouser; Supplier Part Number 1: 603-RT0603BRD0710KL
R39 R48 = RT0603BRD0722K1L: Thin Film Resistors 1/10W 22.1K ohm .1% 25ppm; Manufacturer: YAGEO; Supplier 1: Mouser; Supplier Part Number 1: 603-RT0603BRD0722K1L
R40 R49 = RG1005R-330-D-T10: as R23 on sheet double_single_to_diff_conv; Supplier 1: Mouser; Supplier Part Number 1: 754-RG1005R-330DT10
R41 R50 = RT0603BRD0782KL: Thin Film Resistors 1/10W 82K ohm .1% 25ppm; Manufacturer: YAGEO; Supplier 1: Mouser; Supplier Part Number 1: 603-RT0603BRD0782KL
R42 R51 = ERA-3AEB4752V: as R21 on sheet double_single_to_diff_conv; Supplier 1: Mouser; Supplier Part Number 1: 667-ERA-3AEB4752V
U5 U6 = MCP6489-E/SL: Manufacturer: Microchip Technology; Package: SOIC-14; Supplier 1: Mouser; Supplier Part Number 1: 494-MCP6489-E/SL

## Sheet ADC.SchDoc: ADS127L14 ADC assembly
size A4; DocumentNumber: ADC-SCH-03; SheetNumber: 3; SheetTotal: 20
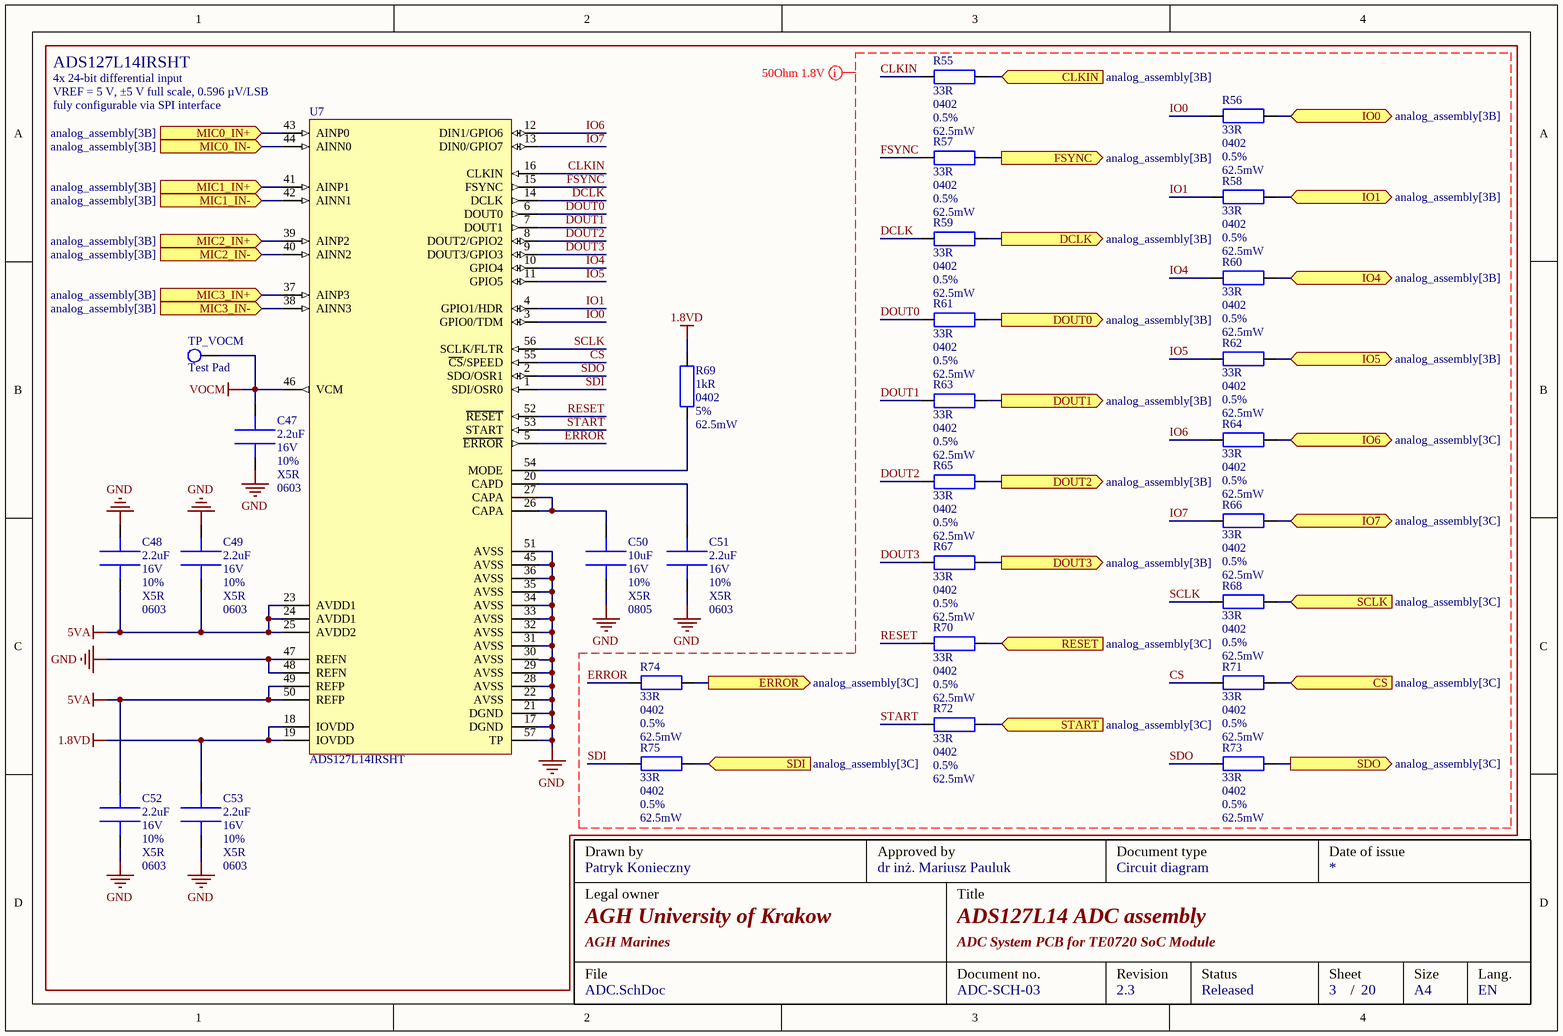
[diagram p13: ADC.SchDoc]

### Parts
C47  value 2.2uF  Voltage: 16V  Tolerance: 10%  Dielectric: X5R  Package: 0603  [CAPC_0603]  (hidden comment: C0603C225K4PAC)
C48  value 2.2uF  Voltage: 16V  Tolerance: 10%  Dielectric: X5R  Package: 0603  [CAPC_0603]  (hidden comment: C0603C225K4PAC)
C49  value 2.2uF  Voltage: 16V  Tolerance: 10%  Dielectric: X5R  Package: 0603  [CAPC_0603]  (hidden comment: C0603C225K4PAC)
C50  value 10uF  Voltage: 16V  Tolerance: 10%  Dielectric: X5R  Package: 0805  [CAPC_0805]  (hidden comment: EMK212BJ106KG-T)
C51  value 2.2uF  Voltage: 16V  Tolerance: 10%  Dielectric: X5R  Package: 0603  [CAPC_0603]  (hidden comment: C0603C225K4PAC)
C52  value 2.2uF  Voltage: 16V  Tolerance: 10%  Dielectric: X5R  Package: 0603  [CAPC_0603]  (hidden comment: C0603C225K4PAC)
C53  value 2.2uF  Voltage: 16V  Tolerance: 10%  Dielectric: X5R  Package: 0603  [CAPC_0603]  (hidden comment: C0603C225K4PAC)
R55  value 33R  Package: 0402  Tolerance: 0.5%  Power: 62.5mW  [RESC_0402]  (hidden comment: RG1005R-330-D-T10)
R56  value 33R  Package: 0402  Tolerance: 0.5%  Power: 62.5mW  [RESC_0402]  (hidden comment: RG1005R-330-D-T10)
R57  value 33R  Package: 0402  Tolerance: 0.5%  Power: 62.5mW  [RESC_0402]  (hidden comment: RG1005R-330-D-T10)
R58  value 33R  Package: 0402  Tolerance: 0.5%  Power: 62.5mW  [RESC_0402]  (hidden comment: RG1005R-330-D-T10)
R59  value 33R  Package: 0402  Tolerance: 0.5%  Power: 62.5mW  [RESC_0402]  (hidden comment: RG1005R-330-D-T10)
R60  value 33R  Package: 0402  Tolerance: 0.5%  Power: 62.5mW  [RESC_0402]  (hidden comment: RG1005R-330-D-T10)
R61  value 33R  Package: 0402  Tolerance: 0.5%  Power: 62.5mW  [RESC_0402]  (hidden comment: RG1005R-330-D-T10)
R62  value 33R  Package: 0402  Tolerance: 0.5%  Power: 62.5mW  [RESC_0402]  (hidden comment: RG1005R-330-D-T10)
R63  value 33R  Package: 0402  Tolerance: 0.5%  Power: 62.5mW  [RESC_0402]  (hidden comment: RG1005R-330-D-T10)
R64  value 33R  Package: 0402  Tolerance: 0.5%  Power: 62.5mW  [RESC_0402]  (hidden comment: RG1005R-330-D-T10)
R65  value 33R  Package: 0402  Tolerance: 0.5%  Power: 62.5mW  [RESC_0402]  (hidden comment: RG1005R-330-D-T10)
R66  value 33R  Package: 0402  Tolerance: 0.5%  Power: 62.5mW  [RESC_0402]  (hidden comment: RG1005R-330-D-T10)
R67  value 33R  Package: 0402  Tolerance: 0.5%  Power: 62.5mW  [RESC_0402]  (hidden comment: RG1005R-330-D-T10)
R68  value 33R  Package: 0402  Tolerance: 0.5%  Power: 62.5mW  [RESC_0402]  (hidden comment: RG1005R-330-D-T10)
R69  value 1kR  Package: 0402  Tolerance: 5%  Power: 62.5mW  [RESC_0402]  (hidden comment: RC0402JR-7D1KL)
R70  value 33R  Package: 0402  Tolerance: 0.5%  Power: 62.5mW  [RESC_0402]  (hidden comment: RG1005R-330-D-T10)
R71  value 33R  Package: 0402  Tolerance: 0.5%  Power: 62.5mW  [RESC_0402]  (hidden comment: RG1005R-330-D-T10)
R72  value 33R  Package: 0402  Tolerance: 0.5%  Power: 62.5mW  [RESC_0402]  (hidden comment: RG1005R-330-D-T10)
R73  value 33R  Package: 0402  Tolerance: 0.5%  Power: 62.5mW  [RESC_0402]  (hidden comment: RG1005R-330-D-T10)
R74  value 33R  Package: 0402  Tolerance: 0.5%  Power: 62.5mW  [RESC_0402]  (hidden comment: RG1005R-330-D-T10)
R75  value 33R  Package: 0402  Tolerance: 0.5%  Power: 62.5mW  [RESC_0402]  (hidden comment: RG1005R-330-D-T10)
TP_VOCM  Test Pad  [TP_1.4mm]
U7  ADS127L14IRSHT  [IC_VQFN56]

### Ports
CLKIN (in, see analog_assembly[3B]), CS (in, see analog_assembly[3C]), DCLK (out, see analog_assembly[3B]), DOUT0 (out, see analog_assembly[3B]), DOUT1 (out, see analog_assembly[3B]), DOUT2 (out, see analog_assembly[3B]), DOUT3 (out, see analog_assembly[3B]), ERROR (out, see analog_assembly[3C]), FSYNC (out, see analog_assembly[3B]), IO0 (bidir, see analog_assembly[3B]), IO1 (bidir, see analog_assembly[3B]), IO4 (bidir, see analog_assembly[3B]), IO5 (bidir, see analog_assembly[3B]), IO6 (bidir, see analog_assembly[3C]), IO7 (bidir, see analog_assembly[3C]), MIC0_IN+ (in, see analog_assembly[3B]), MIC0_IN- (in, see analog_assembly[3B]), MIC1_IN+ (in, see analog_assembly[3B]), MIC1_IN- (in, see analog_assembly[3B]), MIC2_IN+ (in, see analog_assembly[3B]), MIC2_IN- (in, see analog_assembly[3B]), MIC3_IN+ (in, see analog_assembly[3B]), MIC3_IN- (in, see analog_assembly[3B]), RESET (in, see analog_assembly[3C]), SCLK (in, see analog_assembly[3C]), SDI (in, see analog_assembly[3C]), SDO (out, see analog_assembly[3C]), START (in, see analog_assembly[3C])

### Nets
1.8VD: C53.1 R69.2 U7.18(IOVDD) U7.19(IOVDD)
5VA: C48.2 C49.2 C52.1 U7.23(AVDD1) U7.24(AVDD1) U7.25(AVDD2) U7.49(REFP) U7.50(REFP)
GND: C47.2 C48.1 C49.1 C50.2 C51.2 C52.2 C53.2 U7.17(DGND) U7.21(DGND) U7.22(AVSS) U7.28(AVSS) U7.29(AVSS) U7.31(AVSS) U7.32(AVSS) U7.33(AVSS) U7.34(AVSS) U7.35(AVSS) U7.36(AVSS) U7.45(AVSS) U7.47(REFN) U7.48(REFN) U7.51(AVSS) U7.57(TP)
VOCM: C47.1 TP_VOCM.1 U7.46(VCM)
CLKIN: R55.2 U7.16(CLKIN)
CLKIN_FPGA: R55.1 ; port CLKIN
CS: R71.2 U7.55(~{CS}/SPEED)
CS_FPGA: R71.1 ; port CS
DCLK: R59.2 U7.14(DCLK)
DCLK_FPGA: R59.1 ; port DCLK
DOUT0: R61.2 U7.6(DOUT0)
DOUT0_FPGA: R61.1 ; port DOUT0
DOUT1: R63.2 U7.7(DOUT1)
DOUT1_FPGA: R63.1 ; port DOUT1
DOUT2: R65.2 U7.8(DOUT2/GPIO2)
DOUT2_FPGA: R65.1 ; port DOUT2
DOUT3: R67.2 U7.9(DOUT3/GPIO3)
DOUT3_FPGA: R67.1 ; port DOUT3
ERROR: R74.2 U7.5(~{ERROR})
ERROR_FPGA: R74.1 ; port ERROR
FSYNC: R57.2 U7.15(FSYNC)
FSYNC_FPGA: R57.1 ; port FSYNC
IO0: R56.2 U7.3(GPIO0/TDM)
IO0_FPGA: R56.1 ; port IO0
IO1: R58.2 U7.4(GPIO1/HDR)
IO1_FPGA: R58.1 ; port IO1
IO4: R60.2 U7.10(GPIO4)
IO4_FPGA: R60.1 ; port IO4
IO5: R62.2 U7.11(GPIO5)
IO5_FPGA: R62.1 ; port IO5
IO6: R64.2 U7.12(DIN1/GPIO6)
IO6_FPGA: R64.1 ; port IO6
IO7: R66.2 U7.13(DIN0/GPIO7)
IO7_FPGA: R66.1 ; port IO7
MIC_FILTER_OUT_N: U7.37(AINP3) ; port MIC3_IN+
MIC_FILTER_OUT_N: U7.39(AINP2) ; port MIC2_IN+  [a separate net that carries the same name]
MIC_FILTER_OUT_N: U7.41(AINP1) ; port MIC1_IN+  [a separate net that carries the same name]
MIC_FILTER_OUT_N: U7.43(AINP0) ; port MIC0_IN+  [a separate net that carries the same name]
MIC_FILTER_OUT_P: U7.38(AINN3) ; port MIC3_IN-
MIC_FILTER_OUT_P: U7.40(AINN2) ; port MIC2_IN-  [a separate net that carries the same name]
MIC_FILTER_OUT_P: U7.42(AINN1) ; port MIC1_IN-  [a separate net that carries the same name]
MIC_FILTER_OUT_P: U7.44(AINN0) ; port MIC0_IN-  [a separate net that carries the same name]
RESET: R70.2 U7.52(~{RESET})
RESET_FPGA: R70.1 ; port RESET
SCLK: R68.2 U7.56(SCLK/FLTR)
SCLK_FPGA: R68.1 ; port SCLK
SDI: R75.2 U7.1(SDI/OSR0)
SDI_FPGA: R75.1 ; port SDI
SDO: R73.2 U7.2(SDO/OSR1)
SDO_FPGA: R73.1 ; port SDO
START: R72.2 U7.53(START)
START_FPGA: R72.1 ; port START
NetC50_1: C50.1 U7.26(CAPA) U7.27(CAPA)
NetC51_1: C51.1 U7.20(CAPD)
NetR69_1: R69.1 U7.54(MODE)

Not connected (* = marked no-connect by the designer): U7 30(AVSS)

### Layout directives
net class 50OhmSingle: CLKIN, CS, DCLK, DOUT0, DOUT1, DOUT2, DOUT3, ERROR, FSYNC, IO0, IO1, IO4, IO5, IO6, IO7, RESET, SCLK, SDI, SDO, START

### Notes on the sheet
- ADS127L14IRSHT
- 4x 24-bit differential input
- (near U7) VREF = 5 V, ±5 V full scale, 0.596 µV/LSB
- (near U7) fuly configurable via SPI interface
- Drawn by
- Approved by
- Document type
- Date of issue
- Legal owner
- Title
- Circuit diagram
- File
- AGH Marines
- Document no.
- Revision
- Status
- Sheet
- Size
- Lang.
- /
- A4
- EN

### Library data of the parts
C47-C49 C51-C53 = C0603C225K4PAC: Multilayer Ceramic Capacitors MLCC - SMD/SMT 16V 2.2uF X5R 0603 10%; Manufacturer: KEMET; Supplier 1: Mouser; Supplier Part Number 1: 80-C0603C225K4PAC
C50 = EMK212BJ106KG-T: Multilayer Ceramic Capacitors MLCC - SMD/SMT 16V 10uF X5R 0805 10 %; Manufacturer: TAIYO YUDEN; Supplier 1: Mouser; Supplier Part Number 1: 963-EMK212BJ106KG-T
R55-R68 R70-R75 = RG1005R-330-D-T10: as R23 on sheet double_single_to_diff_conv; Supplier 1: Mouser; Supplier Part Number 1: 754-RG1005R-330DT10
R69 = RC0402JR-7D1KL: Thick Film Resistors - SMD General Purpose Chip Resistor 0402, 1kOhms, 5%, 1/16W; Manufacturer: YAGEO; Supplier 1: Mouser; Supplier Part Number 1: 603-RC0402JR-7D1KL
U7 = ADS127L14IRSHT: Analog to Digital Converters - ADC; Manufacturer: Texas Instruments; Package: VQFN-56; Supplier 1: Mouser; Supplier Part Number 1: 595-ADS127L14IRSHT

## Sheet switch_isolation.SchDoc: 3.3V Resistor-Zener Clamp for channel input sense
size A4; DocumentNumber: ADC-SCH-10; SheetNumber: 10; SheetTotal: 20
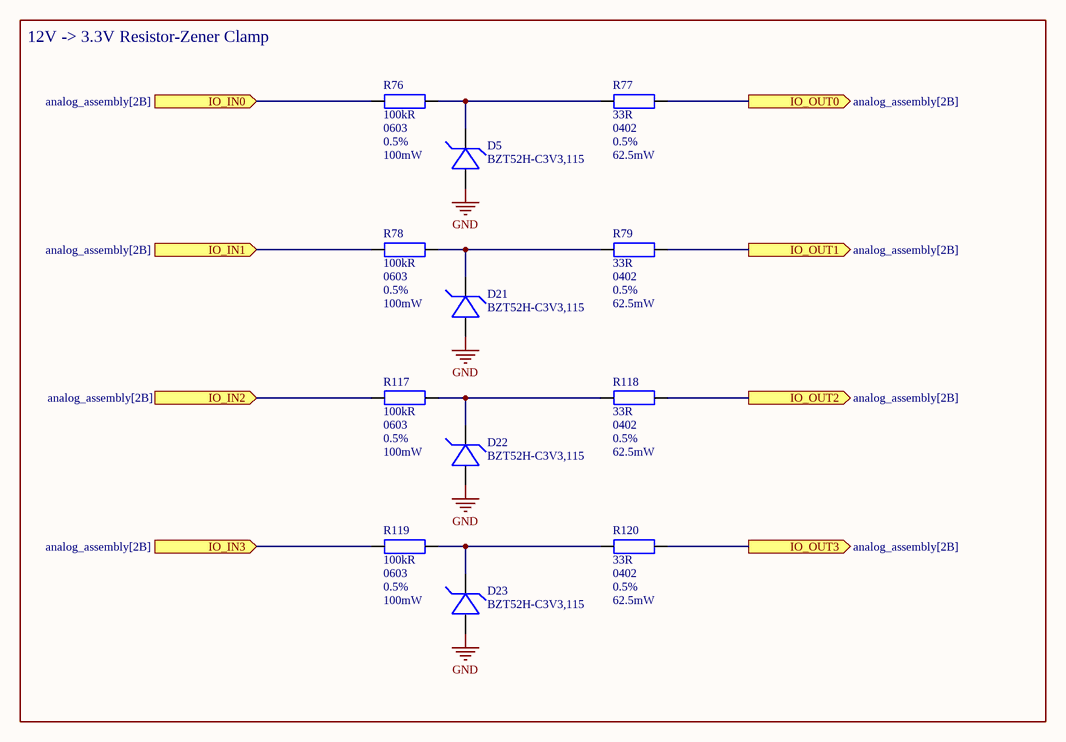
[diagram p14: switch_isolation.SchDoc]

### Parts
D5  BZT52H-C3V3,115  [DIOC_SOD-123F-2]
D21  BZT52H-C3V3,115  [DIOC_SOD-123F-2]
D22  BZT52H-C3V3,115  [DIOC_SOD-123F-2]
D23  BZT52H-C3V3,115  [DIOC_SOD-123F-2]
R76  value 100kR  Package: 0603  Tolerance: 0.5%  Power: 100mW  [RESC_0603]  (hidden comment: AC0603DR-07100KL)
R77  value 33R  Package: 0402  Tolerance: 0.5%  Power: 62.5mW  [RESC_0402]  (hidden comment: RG1005R-330-D-T10)
R78  value 100kR  Package: 0603  Tolerance: 0.5%  Power: 100mW  [RESC_0603]  (hidden comment: AC0603DR-07100KL)
R79  value 33R  Package: 0402  Tolerance: 0.5%  Power: 62.5mW  [RESC_0402]  (hidden comment: RG1005R-330-D-T10)
R117  value 100kR  Package: 0603  Tolerance: 0.5%  Power: 100mW  [RESC_0603]  (hidden comment: AC0603DR-07100KL)
R118  value 33R  Package: 0402  Tolerance: 0.5%  Power: 62.5mW  [RESC_0402]  (hidden comment: RG1005R-330-D-T10)
R119  value 100kR  Package: 0603  Tolerance: 0.5%  Power: 100mW  [RESC_0603]  (hidden comment: AC0603DR-07100KL)
R120  value 33R  Package: 0402  Tolerance: 0.5%  Power: 62.5mW  [RESC_0402]  (hidden comment: RG1005R-330-D-T10)

### Blocks framed on the sheet
12V -> 3.3V Resistor-Zener Clamp: D5 D21-D23 R76-R79 R117-R120

### Ports
IO_IN0 (in, see analog_assembly[2B]), IO_IN1 (in, see analog_assembly[2B]), IO_IN2 (in, see analog_assembly[2B]), IO_IN3 (in, see analog_assembly[2B]), IO_OUT0 (out, see analog_assembly[2B]), IO_OUT1 (out, see analog_assembly[2B]), IO_OUT2 (out, see analog_assembly[2B]), IO_OUT3 (out, see analog_assembly[2B])

### Nets
GND: D5.1 D21.1 D22.1 D23.1
NetD2_U_MIC_connection1_2: R119.2 ; port IO_IN3
NetD2_U_MIC_connection2_2: R117.2 ; port IO_IN2
NetD2_U_MIC_connection3_2: R78.2 ; port IO_IN1
NetD2_U_MIC_connection4_2: R76.2 ; port IO_IN0
NetD5_2: D5.2 R76.1 R77.2
NetD21_2: D21.2 R78.1 R79.2
NetD22_2: D22.2 R117.1 R118.2
NetD23_2: D23.2 R119.1 R120.2
NetJM1_65: R120.1 ; port IO_OUT3
NetJM1_67: R118.1 ; port IO_OUT2
NetJM1_69: R79.1 ; port IO_OUT1
NetJM1_71: R77.1 ; port IO_OUT0

### Notes on the sheet
- Drawn by
- Approved by
- Document type
- Date of issue
- Legal owner
- Title
- Circuit diagram
- File
- AGH Marines
- Document no.
- Revision
- Status
- Sheet
- Size
- Lang.
- /
- A4
- EN

### Library data of the parts
D5 D21-D23 = BZT52H-C3V3,115: Zener Diodes ZENER SOD-123 .83W 3.3V; Manufacturer: Nexperia; Package: SOD-123F-2; Breakdown voltage: 3.3V; Supplier 1: Mouser; Supplier Part Number 1: 771-BZT52H-C3V3-T/R
R76 R78 R117 R119 = AC0603DR-07100KL: Thick Film Resistors - SMD 100 kOhms 1/10 W 75 V 0.5 % 0603 100 PPM / C - 55 C / + 155 C AEC-Q200; Manufacturer: YAGEO; Supplier 1: Mouser; Supplier Part Number 1: 603-AC0603DR-07100KL
R77 R79 R118 R120 = RG1005R-330-D-T10: as R23 on sheet double_single_to_diff_conv; Supplier 1: Mouser; Supplier Part Number 1: 754-RG1005R-330DT10

## Sheet analog_power.SchDoc: Analog power supply and filtration
size A4; DocumentNumber: ADC-SCH-04; SheetNumber: 4; SheetTotal: 20
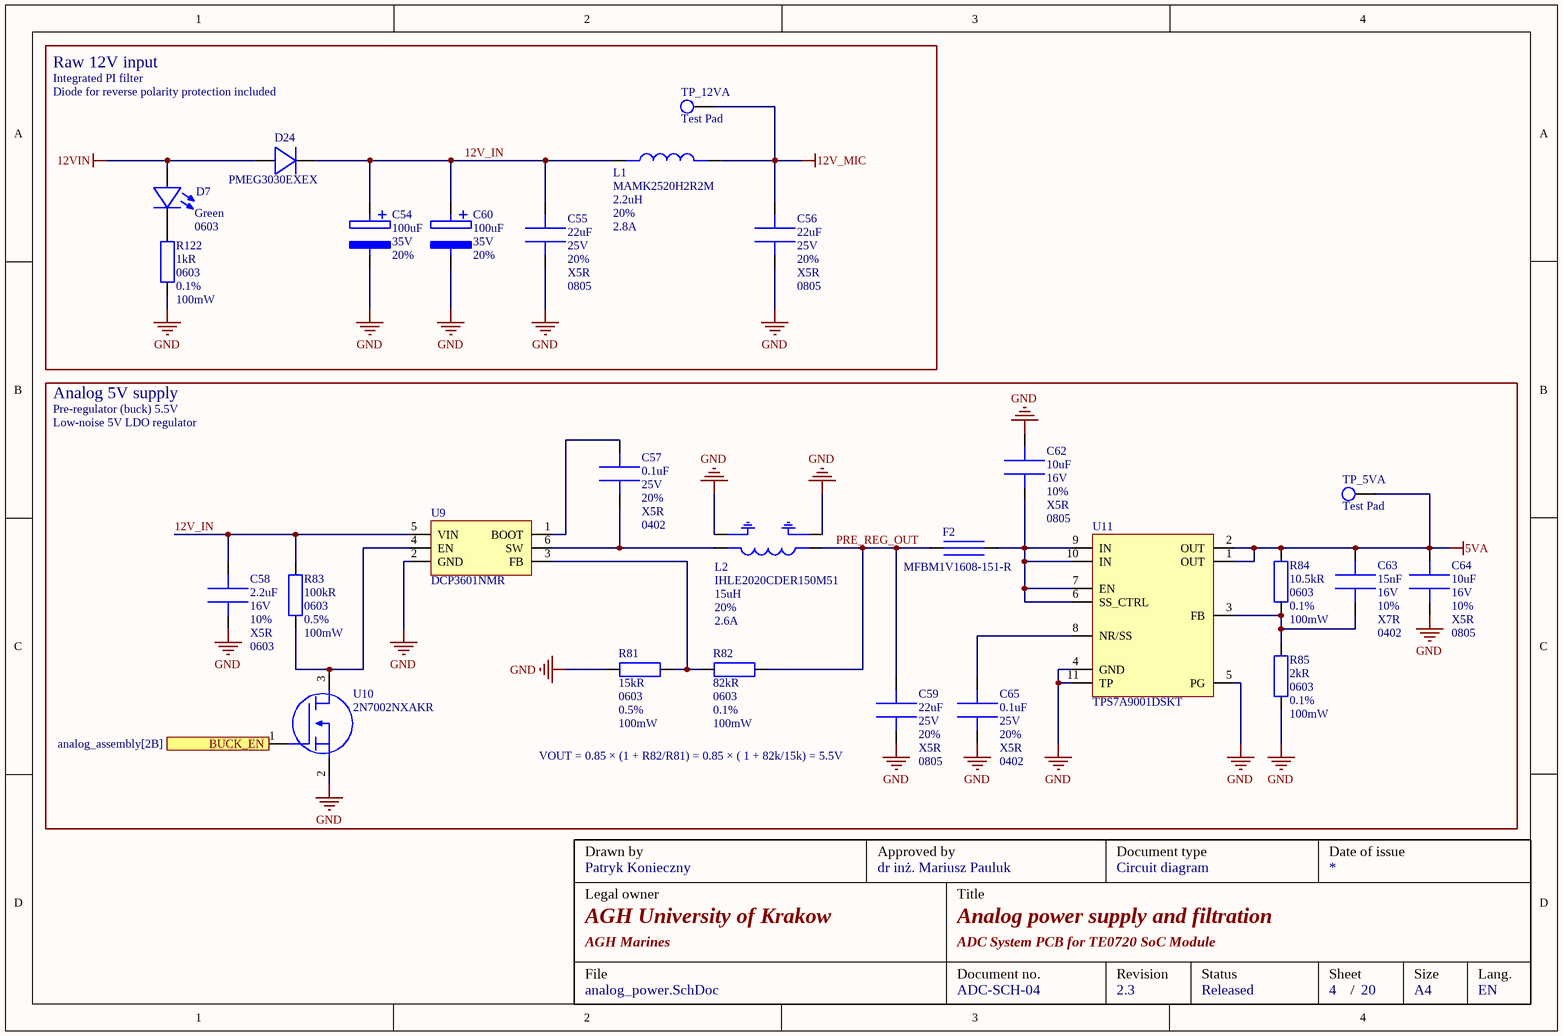
[diagram p15: analog_power.SchDoc]

### Parts
C54  value 100uF  Voltage: 35V  Tolerance: 20%  [CAPE_6.3R_7.7H]  (hidden comment: EDK107M035S9HAA)
C55  value 22uF  Voltage: 25V  Tolerance: 20%  Dielectric: X5R  Package: 0805  [CAPC_0805]  (hidden comment: CL21A226MAYNNNE)
C56  value 22uF  Voltage: 25V  Tolerance: 20%  Dielectric: X5R  Package: 0805  [CAPC_0805]  (hidden comment: CL21A226MAYNNNE)
C57  value 0.1uF  Voltage: 25V  Tolerance: 20%  Dielectric: X5R  Package: 0402  [CAPC_0402]  (hidden comment: MSAST105SB5104MFNA01)
C58  value 2.2uF  Voltage: 16V  Tolerance: 10%  Dielectric: X5R  Package: 0603  [CAPC_0603]  (hidden comment: C0603C225K4PAC)
C59  value 22uF  Voltage: 25V  Tolerance: 20%  Dielectric: X5R  Package: 0805  [CAPC_0805]  (hidden comment: CL21A226MAYNNNE)
C60  value 100uF  Voltage: 35V  Tolerance: 20%  [CAPE_6.3R_7.7H]  (hidden comment: EDK107M035S9HAA)
C62  value 10uF  Voltage: 16V  Tolerance: 10%  Dielectric: X5R  Package: 0805  [CAPC_0805]  (hidden comment: EMK212BJ106KG-T)
C63  value 15nF  Voltage: 16V  Tolerance: 10%  Dielectric: X7R  Package: 0402  [CAPC_0402]  (hidden comment: C0402C153K4RAC)
C64  value 10uF  Voltage: 16V  Tolerance: 10%  Dielectric: X5R  Package: 0805  [CAPC_0805]  (hidden comment: EMK212BJ106KG-T)
C65  value 0.1uF  Voltage: 25V  Tolerance: 20%  Dielectric: X5R  Package: 0402  [CAPC_0402]  (hidden comment: MSAST105SB5104MFNA01)
D7  package: 0603  color: Green  [DIOC_0603_LED]  (hidden comment: KG EELP41.22-PHRH-35-A8J8-20-R18)
D24  PMEG3030EXEX  [DIOC_SOD123HP-2]
F2  MFBM1V1608-151-R  [FERC_0603]
L1  MAMK2520H2R2M  Inductance: 2.2uH  Tolerance: 20%  Saturation Current: 2.8A  [IND_1008]
L2  IHLE2020CDER150M51  Saturation Current: 2.6A  Tolerance: 20%  Inductance: 15uH  [IND_2020_S]
R81  value 15kR  Package: 0603  Tolerance: 0.5%  Power: 100mW  [RESC_0603]  (hidden comment: RT0603DRD0715KL)
R82  value 82kR  Package: 0603  Tolerance: 0.1%  Power: 100mW  [RESC_0603]  (hidden comment: RT0603BRD0782KL)
R83  value 100kR  Package: 0603  Tolerance: 0.5%  Power: 100mW  [RESC_0603]  (hidden comment: AC0603DR-07100KL)
R84  value 10.5kR  Package: 0603  Tolerance: 0.1%  Power: 100mW  [RESC_0603]  (hidden comment: RT0603BRD0710K5L)
R85  value 2kR  Package: 0603  Tolerance: 0.1%  Power: 100mW  [RESC_0603]  (hidden comment: RT0603BRD072KL)
R122  value 1kR  Package: 0603  Tolerance: 0.1%  Power: 100mW  [RESC_0603]  (hidden comment: RP0603BRD071KL)
TP_5VA  Test Pad  [TP_1.4mm]
TP_12VA  Test Pad  [TP_1.4mm]
U9  DCP3601NMR  [IC_SOT23-6]
U10  2N7002NXAKR  [IC_SOT-23-3]
U11  TPS7A9001DSKT  [IC_SON-10]

### Blocks framed on the sheet
Raw 12V input: C54-C56 C60 D7 D24 L1 R122 TP_12VA
Analog 5V supply: C57-C59 C62-C65 F2 L2 R81-R85 TP_5VA U9-U11

### Ports
BUCK_EN (in, see analog_assembly[2B])

### Nets
5VA: C63.1 C64.1 R84.1 TP_5VA.1 U11.1(OUT) U11.2(OUT)
12V_MIC: C56.1 L1.2 TP_12VA.1
12VIN: D7.1 D24.1
GND: C54.2 C55.2 C56.2 C58.2 C59.2 C60.2 C62.1 C64.2 C65.2 L2.3 L2.4 R81.2 R85.2 R122.2 U9.2(GND) U10.2(S) U11.4(GND) U11.5(PG) U11.11(TP)
12V_IN: C54.1 C55.1 C58.1 C60.1 D24.2 L1.1 R83.1 U9.5(VIN)
PRE_REG_OUT: C59.1 F2.2 L2.1 R82.1
NetC57_1: C57.1 U9.1(BOOT)
NetC57_2: C57.2 L2.2 U9.6(SW)
NetC62_2: C62.2 F2.1 U11.6(SS_CTRL) U11.7(EN) U11.9(IN) U11.10(IN)
NetC63_2: C63.2 R84.2 R85.1 U11.3(FB)
NetC65_1: C65.1 U11.8(NR/SS)
NetD7_2: D7.2 R122.1
NetJM3_26: U10.1(G) ; port BUCK_EN
NetR81_1: R81.1 R82.2 U9.3(FB)
NetR83_2: R83.2 U9.4(EN) U10.3(D)

### Notes on the sheet
- Integrated PI filter
- Diode for reverse polarity protection included
- Pre-regulator (buck) 5.5V
- Low-noise 5V LDO regulator
- (near C59) VOUT = 0.85 × (1 + R82/R81) = 0.85 × ( 1 + 82k/15k) = 5.5V
- Drawn by
- Approved by
- Document type
- Date of issue
- Legal owner
- Title
- Circuit diagram
- File
- AGH Marines
- Document no.
- Revision
- Status
- Sheet
- Size
- Lang.
- /
- A4
- EN

### Library data of the parts
C54 C60 = EDK107M035S9HAA: Aluminum Electrolytic Capacitors - SMD 35V 100uF AEC-Q200 20% 85C/2K Hours; Manufacturer: KEMET; Package: 6.3x7.7; Supplier 1: Mouser; Supplier Part Number 1: 80-EDK107M035S9HAA
C55 C56 C59 = CL21A226MAYNNNE: Multilayer Ceramic Capacitors MLCC - SMD/SMT 22uF+/-20% 25V X5R 2 0805; Manufacturer: TAIYO YUDEN; Supplier 1: Mouser; Supplier Part Number 1: 187-CL21A226MAYNNNE
C57 C65 = MSAST105SB5104MFNA01: as C17 on sheet double_single_to_diff_conv; Supplier 1: Mouser; Supplier Part Number 1: 963-MSAST105SB5104MF
C58 = C0603C225K4PAC: as C47-C49 on sheet ADC; Supplier 1: Mouser; Supplier Part Number 1: 80-C0603C225K4PAC
C62 C64 = EMK212BJ106KG-T: as C50 on sheet ADC; Supplier 1: Mouser; Supplier Part Number 1: 963-EMK212BJ106KG-T
C63 = C0402C153K4RAC: Multilayer Ceramic Capacitors MLCC - SMD/SMT 16V 0.015uF X7R 0402 10%; Manufacturer: KEMET; Supplier 1: Mouser; Supplier Part Number 1: 80-C0402C153K4RAC
D7 = KG EELP41.22-PHRH-35-A8J8-20-R18: Single Color LEDs; Supplier 1: Mouser; Supplier Part Number 1: 720-P4122PHRH35A8J82
D24 = PMEG3030EXEX: Schottky Diodes & Rectifiers RECT 30V 3A SM SCHOTTKY; Manufacturer: Nexperia; Forward Voltage: 500mV; Package: SOD123HP-2; Current: 3A; Supplier 1: Mouser; Supplier Part Number 1: 771-PMEG3030EXEX
F2 = BBPY00160808471Y00: Ferrite Beads 470Ohms RDC=0.15Ohms 1500mA; Manufacturer: Pulse Electronics; Package: 0603; Supplier 1: Mouser; Supplier Part Number 1: 603-BBPY160808471Y00
L1 = MAMK2520H2R2M: Power Inductors - SMD 963-LSAPB2520MKT2R2M RPLCMT PN 1008 2.2uH 90mOhmsur; Manufacturer: TAIYO YUDEN; Package: 1008; Supplier 1: Mouser; Supplier Part Number 1: 963-MAMK2520H2R2M
L2 = IHLE2020CDER150M51: Power Inductors - SMD 15uH 20% w/E-Field; Manufacturer: Vishay; Package: 2020; Supplier 1: Mouser; Supplier Part Number 1: 70-IHLE2020CDR150M51
R81 = RT0603DRD0715KL: Thin Film Resistors 15K Ohm 0.5% 1/10W 75 Volts 25ppm; Manufacturer: YAGEO; Supplier 1: Mouser; Supplier Part Number 1: 603-RT0603DRD0715KL
R82 = RT0603BRD0782KL: as R41 on sheet band_pass_diff_filter; Supplier 1: Mouser; Supplier Part Number 1: 603-RT0603BRD0782KL
R83 = AC0603DR-07100KL: as R76 on sheet switch_isolation; Supplier 1: Mouser; Supplier Part Number 1: 603-AC0603DR-07100KL
R84 = RT0603BRD0710K5L: Thin Film Resistors 1/10W 10.5K ohm .1% 25ppm; Manufacturer: YAGEO; Supplier 1: Mouser; Supplier Part Number 1: 603-RT0603BRD0710K5L
R85 = RT0603BRD072KL: Thin Film Resistors 2K OHM .1% 25PPM; Manufacturer: YAGEO; Supplier 1: Mouser; Supplier Part Number 1: 603-RT0603BRD072KL
R122 = RP0603BRD071KL: as R24 on sheet double_single_to_diff_conv; Supplier 1: Mouser; Supplier Part Number 1: 603-RP0603BRD071KL
U9 = DCP3601NMR: Switching Voltage Regulators 36 V, 1 A synchronous step-down converter in SOT23-6L; Manufacturer: STMicroelectronics; Package: SOT23-6; Supplier 1: Mouser; Supplier Part Number 1: 511-DCP3601NMR
U10 = 2N7002NXAKR: MOSFETs SOT23 N-CH 60V .3A; Manufacturer: Nexperia; Package: SOT23-3; Supplier 1: Mouser; Supplier Part Number 1: 771-2N7002NXAKR
U11 = TPS7A9001DSKT: LDO Voltage Regulators 500-mA low-noise h igh-PSRR adjustable A 595-TPS7A9001DSKR; Manufacturer: Texas Instruments; Package: SON-10; Supplier 1: Mouser; Supplier Part Number 1: 595-TPS7A9001DSKT